# Altium schematic sheet 06_OLED_SHT3X.SchDoc
size A3; SheetNumber: 6; SheetTotal: 7
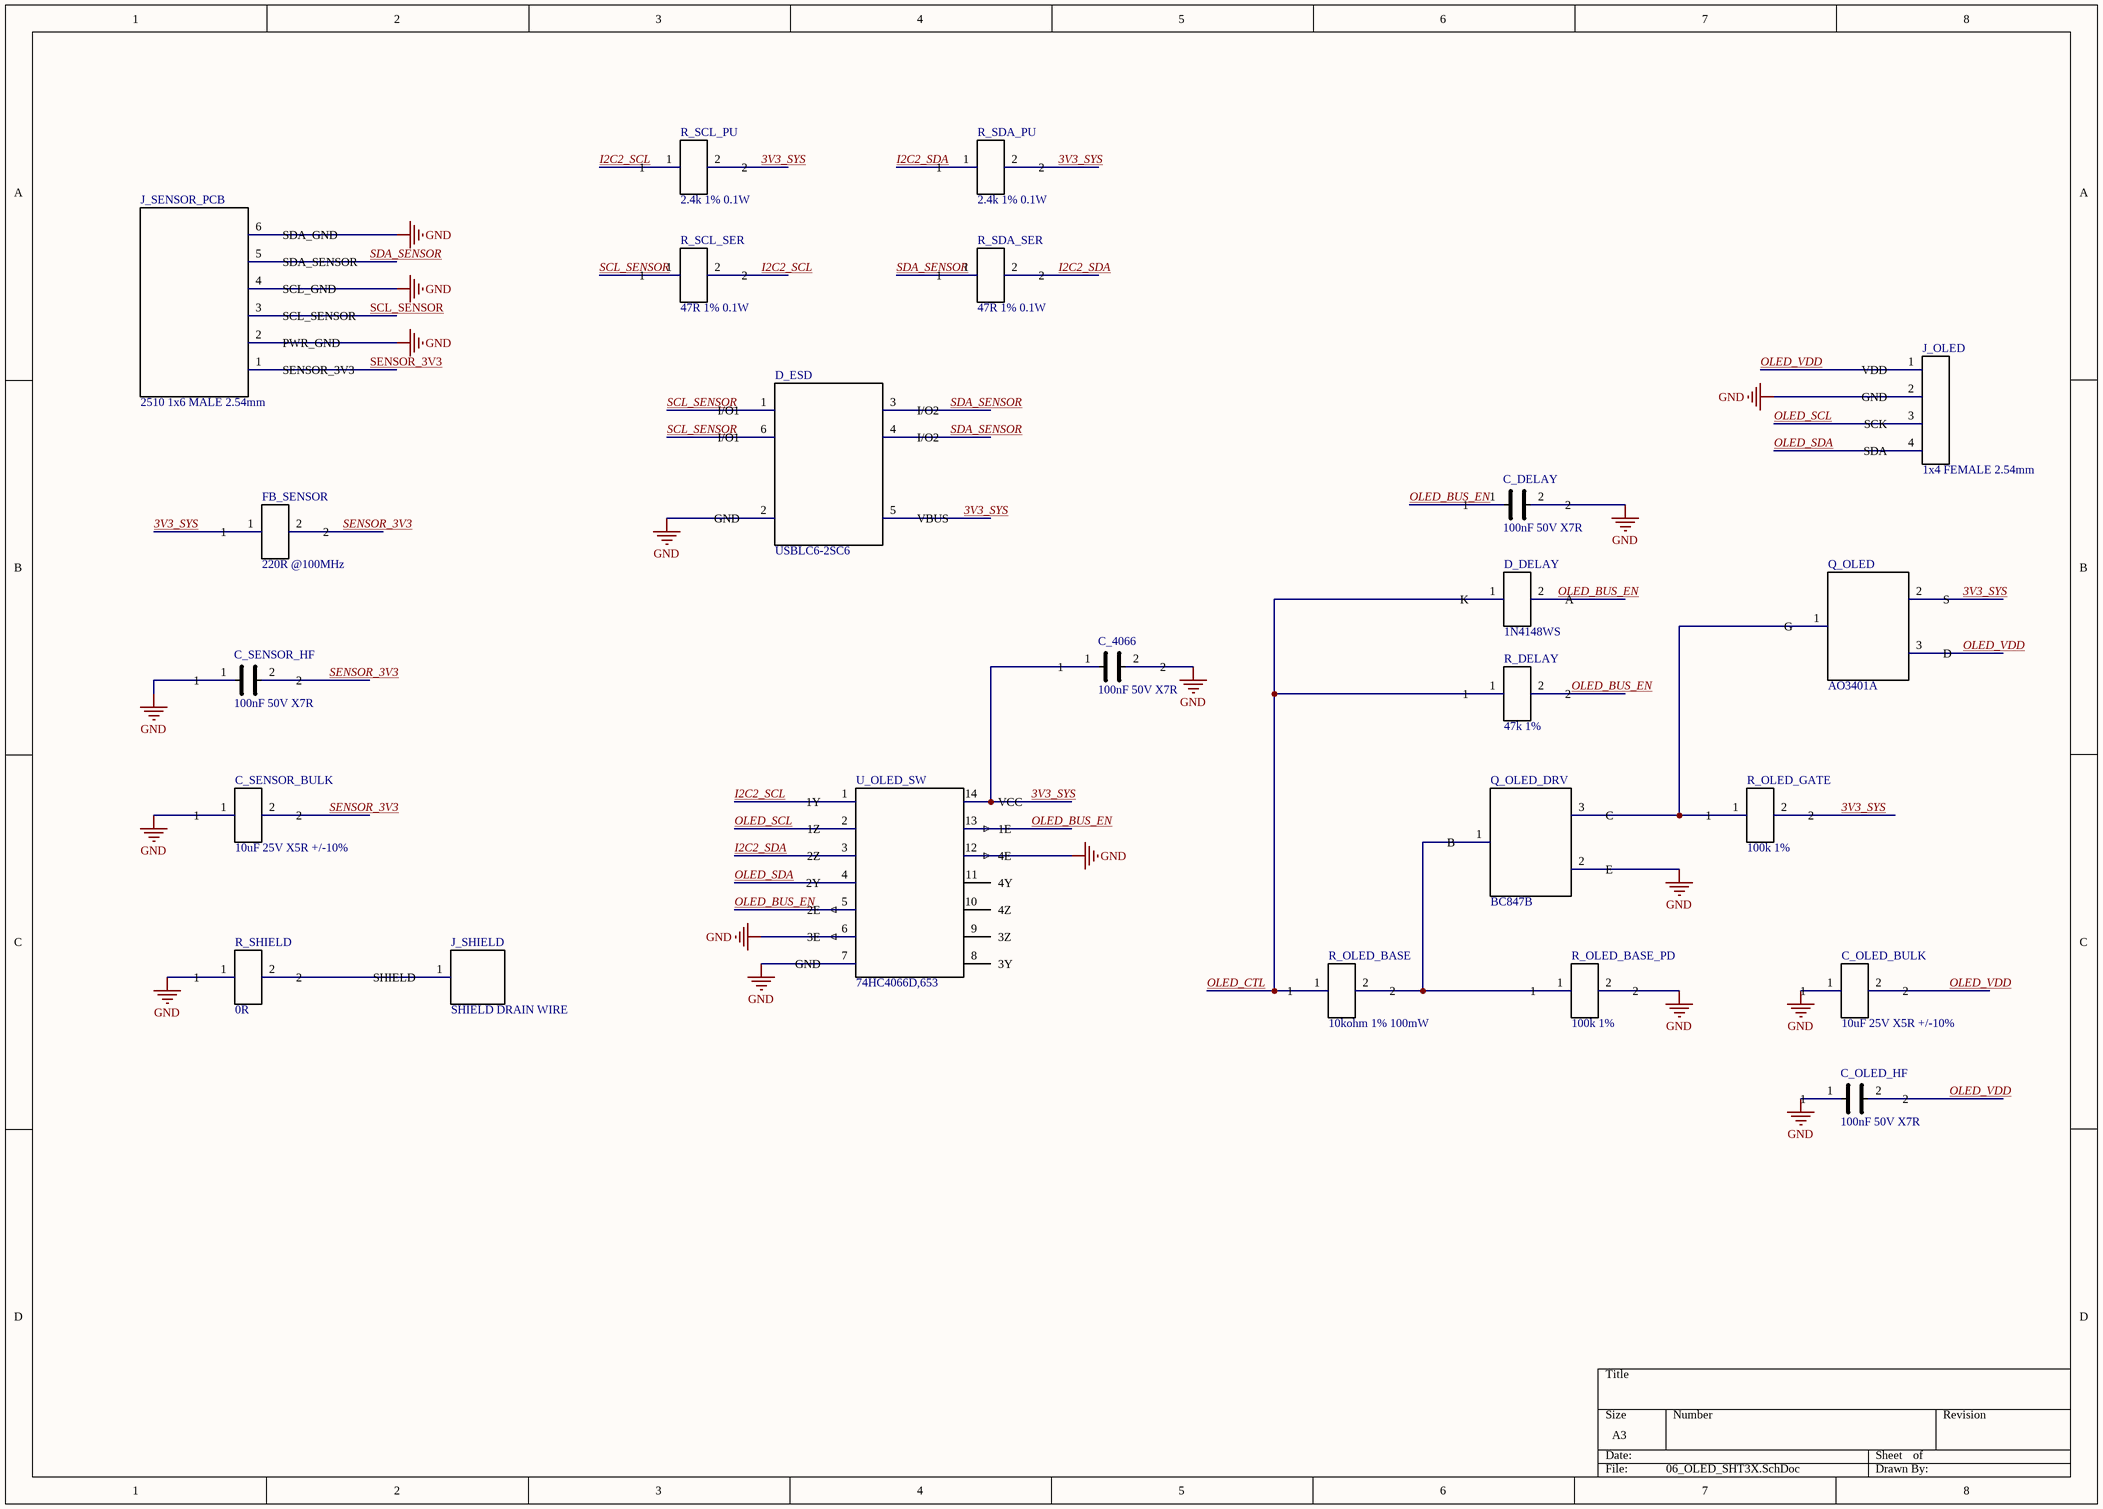
[diagram p0: 06_OLED_SHT3X.SchDoc]

## Parts
C_4066  100nF 50V X7R  [SAMSUNG_CL10_0603_CAP_2P]
C_DELAY  100nF 50V X7R  [SAMSUNG_CL10_0603_CAP_2P]
C_OLED_BULK  10uF 25V X5R +/-10%  [MURATA_GRM21_0805_CAP_2P]
C_OLED_HF  100nF 50V X7R  [SAMSUNG_CL10_0603_CAP_2P]
C_SENSOR_BULK  10uF 25V X5R +/-10%  [MURATA_GRM21_0805_CAP_2P]
C_SENSOR_HF  100nF 50V X7R  [SAMSUNG_CL10_0603_CAP_2P]
D_DELAY  1N4148WS  [DIODES_SOD323_1N4148WS_2P]
D_ESD  USBLC6-2SC6  [ST_SOT23_6L_USBLC6_6P]
FB_SENSOR  220R @100MHz  [RES_0805_SHARED_2P]
J_OLED  1x4 FEMALE 2.54mm  [GENERIC_SOCKET_1X4_P2P54_THT]
J_SENSOR_PCB  2510 1x6 MALE 2.54mm  [GENERIC_2510_1X6_P2P54_THT]
J_SHIELD  SHIELD DRAIN WIRE  [WIRE_DRAIN_1P_D1P20_P2P40_THT]
Q_OLED  AO3401A  [AOS_SOT23_AO3401A_3P]
Q_OLED_DRV  BC847B  [NEXPERIA_SOT23_TO236AB_3P]
R_DELAY  47k 1%  [RES_0603_SHARED_2P]
R_OLED_BASE  10kohm 1% 100mW  [RES_0603_SHARED_2P]
R_OLED_BASE_PD  100k 1%  [RES_0603_SHARED_2P]
R_OLED_GATE  100k 1%  [RES_0603_SHARED_2P]
R_SCL_PU  2.4k 1% 0.1W  [RES_0603_SHARED_2P]
R_SCL_SER  47R 1% 0.1W  [RES_0603_SHARED_2P]
R_SDA_PU  2.4k 1% 0.1W  [RES_0603_SHARED_2P]
R_SDA_SER  47R 1% 0.1W  [RES_0603_SHARED_2P]
R_SHIELD  0R  [RES_0603_SHARED_2P]
U_OLED_SW  74HC4066D,653  [NEXPERIA_SOT108_1_SO14_14P]

## Nets
GND: C_4066.2 C_DELAY.2 C_OLED_BULK.1 C_OLED_HF.1 C_SENSOR_BULK.1 C_SENSOR_HF.1 D_ESD.2(GND) J_OLED.2(GND) J_SENSOR_PCB.2(PWR_GND) J_SENSOR_PCB.4(SCL_GND) J_SENSOR_PCB.6(SDA_GND) Q_OLED_DRV.2(E) R_OLED_BASE_PD.2 R_SHIELD.1 U_OLED_SW.6(3E) U_OLED_SW.7(GND) U_OLED_SW.12(4E)
3V3_SYS: C_4066.1 D_ESD.5(VBUS) FB_SENSOR.1 Q_OLED.2(S) R_OLED_GATE.2 R_SCL_PU.2 R_SDA_PU.2 U_OLED_SW.14(VCC)
I2C2_SCL: R_SCL_PU.1 R_SCL_SER.2 U_OLED_SW.1(1Y)
I2C2_SDA: R_SDA_PU.1 R_SDA_SER.2 U_OLED_SW.3(2Z)
OLED_BUS_EN: C_DELAY.1 D_DELAY.2(A) R_DELAY.2 U_OLED_SW.5(2E) U_OLED_SW.13(1E)
OLED_CTL: D_DELAY.1(K) R_DELAY.1 R_OLED_BASE.1
OLED_SCL: J_OLED.3(SCK) U_OLED_SW.2(1Z)
OLED_SDA: J_OLED.4(SDA) U_OLED_SW.4(2Y)
OLED_VDD: C_OLED_BULK.2 C_OLED_HF.2 J_OLED.1(VDD) Q_OLED.3(D)
SCL_SENSOR: D_ESD.1(I/O1) D_ESD.6(I/O1) J_SENSOR_PCB.3(SCL_SENSOR) R_SCL_SER.1
SDA_SENSOR: D_ESD.3(I/O2) D_ESD.4(I/O2) J_SENSOR_PCB.5(SDA_SENSOR) R_SDA_SER.1
SENSOR_3V3: C_SENSOR_BULK.2 C_SENSOR_HF.2 FB_SENSOR.2 J_SENSOR_PCB.1(SENSOR_3V3)
NetJ_SHIELD_1: J_SHIELD.1(SHIELD) R_SHIELD.2
NetQ_OLED_1: Q_OLED.1(G) Q_OLED_DRV.3(C) R_OLED_GATE.1
NetQ_OLED_DRV_1: Q_OLED_DRV.1(B) R_OLED_BASE.2 R_OLED_BASE_PD.1

Not connected (* = marked no-connect by the designer): U_OLED_SW 8(3Y) 9(3Z) 10(4Z) 11(4Y)

## Library data of the parts
C_4066 C_DELAY C_OLED_HF C_SENSOR_HF = CL10B104KB8NNNC: MCU-core ceramic capacitor; Manufacturer: Samsung Electro-Mechanics; Source_Baseline: MCU_SCHEMATIC_ENTRY_BASELINE_v2.1_FA.txt; Design_Status: DESIGN_LOCK_MCU_CORE_V2.1_FOOTPRINT_HOLD; Qualification_Status: UNQUALIFIED_PENDING_SAVE_REOPEN_AUDIT; PIN_NUMBER_SOURCE: INTERNAL_CONVENTION; PIN_FUNCTION_SOURCE: MANUFACTURER_DATASHEET; MPN: CL10B104KB8NNNC; Value: 100nF 50V X7R; Package: 0603 / 1608 metric; Datasheet: https://product.samsungsem.com/mlcc/CL10B104KB8NNN.do
C_OLED_BULK C_SENSOR_BULK = GRM21BR61E106KA73L: MicroSD local mid-value ceramic capacitor; Manufacturer: Murata Manufacturing; Source_Baseline: MICROSD_SCHEMATIC_ENTRY_BASELINE_v1.2_FA.txt; Design_Status: DESIGN_LOCK_MICROSD_V1.2_FOOTPRINT_COMPARE_PENDING; Qualification_Status: UNQUALIFIED_PENDING_SAVE_REOPEN_AUDIT; PIN_NUMBER_SOURCE: INTERNAL_CONVENTION_1_2; PIN_FUNCTION_SOURCE: MANUFACTURER_PRODUCT_DATA; MPN: GRM21BR61E106KA73L; Value: 10uF 25V X5R +/-10%; Package: 2012M / EIA 0805; Datasheet: https://pim.murata.com/en-global/pim/details/?partNum=GRM21BR61E106KA73%23
D_DELAY = 1N4148WS: Fast switching diode; SOD323; pin 1 cathode K, pin 2 anode A for Task19 delay discharge path; Manufacturer: MULTISOURCE; FOOTPRINT GEOMETRY SOURCE=Diodes Incorporated; Source_Baseline: Datalogger_OLED_SHT3x_Final_BOM_RevA_v1.3_FA.pdf + TASK18_RTC_RELEASE_2026-08-22 + TASK19_CONTROLLED_DELTAS_2026-08-22; Design_Status: TASK19_BOM_DEVICE_GEOMETRY_DIODES_INC_REFERENCE; Qualification_Status: UNQUALIFIED_PENDING_SAVE_REOPEN_AUDIT; PIN_NUMBER_SOURCE: MANUFACTURER_DATASHEET; MPN: 1N4148WS; Value: 1N4148WS; Package: SOD323; Datasheet: https://www.diodes.com/datasheet/download/1N4148WS.pdf; PIN_FUNCTION_SOURCE: MANUFACTURER_DATASHEET
D_ESD = USBLC6-2SC6: Two-line low-capacitance ESD protector; ST device purchased for Rev-A; Manufacturer: STMicroelectronics; Source_Baseline: MICROSD_SCHEMATIC_ENTRY_BASELINE_v1.2_FA.txt; Design_Status: DESIGN_LOCK_MICROSD_V1.2_ST_PROCUREMENT; Qualification_Status: UNQUALIFIED_PENDING_SAVE_REOPEN_AUDIT; PIN_NUMBER_SOURCE: MANUFACTURER_DATASHEET; MPN: USBLC6-2SC6; Value: USBLC6-2SC6; Package: SOT23-6L; Datasheet: https://www.st.com/resource/en/datasheet/usblc6-2.pdf; PIN_FUNCTION_SOURCE: MANUFACTURER_DATASHEET
FB_SENSOR = BLM21PG221SN1D: Murata BLM21PG ferrite bead, 0805/2012, Task19 sensor supply filter; Manufacturer: Murata Manufacturing Co., Ltd.; Source_Baseline: Datalogger_OLED_SHT3x_Final_BOM_RevA_v1.3_FA.pdf + TASK18_RTC_RELEASE_2026-08-22 + TASK19_CONTROLLED_DELTAS_2026-08-22; Design_Status: TASK19_CONTROLLED_BOM_REUSE_RES_0805_SHARED_2P; Qualification_Status: UNQUALIFIED_PENDING_SAVE_REOPEN_AUDIT; PIN_NUMBER_SOURCE: INTERNAL_CONVENTION; PIN_FUNCTION_SOURCE: SYMMETRIC_PASSIVE_DEVICE; MPN: BLM21PG221SN1D; Value: 220R @100MHz; Package: 0805 / 2012 metric; Datasheet: Murata official BLM21PG221SN1D product data
J_OLED = PBS-2.54-1X4GF: Generic 1x4 straight female THT socket for OLED module; purchase identity PBS-2.54-1X4GF; module side is male; Source_Baseline: Datalogger_OLED_SHT3x_Final_BOM_RevA_v1.3_FA.pdf + TASK18_RTC_RELEASE_2026-08-22 + TASK19_CONTROLLED_DELTAS_2026-08-22; Design_Status: TASK19_GENERIC_HEADER_USER_APPROVED_2026-08-22; Qualification_Status: UNQUALIFIED_PENDING_SAVE_REOPEN_AUDIT; PIN_NUMBER_SOURCE: PROJECT_INTERNAL_LEFT_TO_RIGHT_1_TO_4; PIN_FUNCTION_SOURCE: OLED_MODULE_PRINT_AND_CONTROLLED_BOM; Manufacturer: GENERIC; MPN: PBS-2.54-1X4GF; Value: 1x4 FEMALE 2.54mm; Package: THT 1x4, pitch 2.54 mm; Datasheet: Generic geometry reference: Wurth Elektronik 61300411821; project user approval 2026-08-22
J_SENSOR_PCB = 2510-1X6-MALE-THT: PCB-mounted internal SHT3x harness connector; 6-pin straight male 2.54 mm 2510-style THT; external metal/military panel connector remains separate; Manufacturer: GENERIC; Source_Baseline: T20_USER_APPROVAL_2026-08-26; Design_Status: TASK20_CONTROLLED_PCB_CONNECTOR; Qualification_Status: MECHANICAL_FIT_PENDING_PHYSICAL_SAMPLE; PIN_NUMBER_SOURCE: PROJECT_INTERNAL_PCB_ORDER_LOCK_2026-08-26; PIN_FUNCTION_SOURCE: USER_APPROVED_T20_SIGNAL_ORDER_2026-08-26; MPN: 2510-1X6-MALE-THT; Value: 2510 1x6 MALE 2.54mm; Package: THT 1x6, pitch 2.54 mm; Datasheet: USER_SUPPLIED_6CCT_2P54_DRAWING_2026-08-26; supplier code 2171001040
J_SHIELD = WIRE_DRAIN_1P_THT: Dedicated PCB termination for external cable shield/drain wire; 1-pin THT solder pad; Task20 controlled; Manufacturer: GENERIC; Design_Status: TASK20_CONTROLLED; Qualification_Status: PHYSICAL_FIT_PENDING; Cable_Target: 3-pair x 24AWG shielded, drain wire; MPN: WIRE_DRAIN_1P_THT; Value: SHIELD DRAIN WIRE; Package: 1-pin THT solder pad
Q_OLED = AO3401A: -30V P-channel MOSFET used as switched SD_VDD high-side pass element; Manufacturer: Alpha & Omega Semiconductor; Source_Baseline: MICROSD_SCHEMATIC_ENTRY_BASELINE_v1.2_FA.txt; Design_Status: DESIGN_LOCK_MICROSD_V1.2_PIN_NUMBER_CONVENTION_PENDING_FOOTPRINT_CROSSCHECK; Qualification_Status: UNQUALIFIED_PENDING_SAVE_REOPEN_AUDIT; PIN_NUMBER_SOURCE: INTERNAL_CONVENTION_PENDING_PHYSICAL_ORIENTATION_CROSSCHECK; PIN_FUNCTION_SOURCE: MANUFACTURER_DATASHEET; MPN: AO3401A; Value: AO3401A; Package: SOT-23; Datasheet: https://www.aosmd.com/sites/default/files/res/datasheets/AO3401A.pdf
Q_OLED_DRV = BC847B: 45V 100mA NPN general-purpose transistor used as SD gate driver; Manufacturer: Nexperia; Source_Baseline: MICROSD_SCHEMATIC_ENTRY_BASELINE_v1.2_FA.txt; Design_Status: DESIGN_LOCK_MICROSD_V1.2; Qualification_Status: UNQUALIFIED_PENDING_SAVE_REOPEN_AUDIT; PIN_NUMBER_SOURCE: MANUFACTURER_DATASHEET; MPN: BC847B; Value: BC847B; Package: SOT-23 / TO-236AB; Datasheet: https://assets.nexperia.com/documents/data-sheet/BC847X_SER.pdf; PIN_FUNCTION_SOURCE: MANUFACTURER_DATASHEET
R_DELAY = 0603WAF4702T5E: OVP resistor; Manufacturer: UNI-ROYAL; Source_Baseline: POWER_SCHEMATIC_ENTRY_BASELINE_v0.17_FA.txt; Design_Status: CONTROLLED_V0.17_P9; Qualification_Status: UNQUALIFIED_PENDING_SAVE_REOPEN_AUDIT; PIN_NUMBER_SOURCE: INTERNAL_CONVENTION; PIN_FUNCTION_SOURCE: MANUFACTURER_DATASHEET; MPN: 0603WAF4702T5E; Value: 47k 1%; Package: 0603; Datasheet: UNI-ROYAL manufacturer resistor data
R_OLED_BASE = CR0603FA1002G: MicroSD SD gate-driver base resistor; Manufacturer: LIZ [supplier-listed]; Source_Baseline: MICROSD_SCHEMATIC_ENTRY_BASELINE_v1.2_FA.txt; Design_Status: DESIGN_LOCK_MICROSD_V1.2_FOOTPRINT_SOURCE_HOLD; Qualification_Status: UNQUALIFIED_PENDING_SAVE_REOPEN_AUDIT; PIN_NUMBER_SOURCE: INTERNAL_CONVENTION_1_2; PIN_FUNCTION_SOURCE: CONTROLLED_BOM_PLUS_EXACT_PART_LISTING; MPN: CR0603FA1002G; Value: 10kohm 1% 100mW; Package: 0603; Datasheet: MicroSD v1.3 plus exact-part supplier listing
R_OLED_BASE_PD R_OLED_GATE = 0603WAF1003T5E: OVP resistor; Manufacturer: UNI-ROYAL; Source_Baseline: POWER_SCHEMATIC_ENTRY_BASELINE_v0.17_FA.txt; Design_Status: CONTROLLED_V0.17_P9; Qualification_Status: UNQUALIFIED_PENDING_SAVE_REOPEN_AUDIT; PIN_NUMBER_SOURCE: INTERNAL_CONVENTION; PIN_FUNCTION_SOURCE: MANUFACTURER_DATASHEET; MPN: 0603WAF1003T5E; Value: 100k 1%; Package: 0603; Datasheet: UNI-ROYAL manufacturer resistor data
R_SCL_PU R_SDA_PU = 0603WAF2401T5E: Task19 external SHT3x I2C pull-up resistor; Manufacturer: UNI-ROYAL; Source_Baseline: Datalogger_OLED_SHT3x_Final_BOM_RevA_v1.3_FA.pdf + TASK18_RTC_RELEASE_2026-08-22 + TASK19_CONTROLLED_DELTAS_2026-08-22; Design_Status: TASK19_CONTROLLED_BOM_REUSE_RES_0603_SHARED_2P; Qualification_Status: UNQUALIFIED_PENDING_SAVE_REOPEN_AUDIT; PIN_NUMBER_SOURCE: INTERNAL_CONVENTION; PIN_FUNCTION_SOURCE: SYMMETRIC_PASSIVE_DEVICE; MPN: 0603WAF2401T5E; Value: 2.4k 1% 0.1W; Package: 0603 / 1608 metric; Datasheet: Controlled BOM value/package; existing UNI-ROYAL WAF family in released project library
R_SCL_SER R_SDA_SER = 0603WAF470JT5E: Task19 SHT3x I2C series resistor; Manufacturer: UNI-ROYAL; Source_Baseline: Datalogger_OLED_SHT3x_Final_BOM_RevA_v1.3_FA.pdf + TASK18_RTC_RELEASE_2026-08-22 + TASK19_CONTROLLED_DELTAS_2026-08-22; Design_Status: TASK19_CONTROLLED_BOM_REUSE_RES_0603_SHARED_2P; Qualification_Status: UNQUALIFIED_PENDING_SAVE_REOPEN_AUDIT; PIN_NUMBER_SOURCE: INTERNAL_CONVENTION; PIN_FUNCTION_SOURCE: SYMMETRIC_PASSIVE_DEVICE; MPN: 0603WAF470JT5E; Value: 47R 1% 0.1W; Package: 0603 / 1608 metric; Datasheet: Controlled BOM value/package; existing UNI-ROYAL WAF family in released project library
R_SHIELD = SER0603J0R: Zero-ohm mode strap; Manufacturer: VICO / Anhui Xiangsheng Technology; Source_Baseline: POWER_SCHEMATIC_ENTRY_BASELINE_v0.17_FA.txt; Design_Status: DESIGN_LOCK_V0.17; Qualification_Status: UNQUALIFIED_PENDING_SAVE_REOPEN_AUDIT; PIN_NUMBER_SOURCE: INTERNAL_CONVENTION; PIN_FUNCTION_SOURCE: MANUFACTURER_DATASHEET; MPN: SER0603J0R; Value: 0R; Package: 0603; Datasheet: SER0603J0R-VO-Sub-Brand-(ER).pdf
U_OLED_SW = 74HC4066D,653: Nexperia quad SPST analog switch; enable inputs active HIGH; SO14 SOT108-1; Source_Baseline: Datalogger_OLED_SHT3x_Final_BOM_RevA_v1.3_FA.pdf + TASK18_RTC_RELEASE_2026-08-22 + TASK19_CONTROLLED_DELTAS_2026-08-22; Design_Status: TASK19_CONTROLLED_NEXPERIA_REV12; Qualification_Status: UNQUALIFIED_PENDING_SAVE_REOPEN_AUDIT; PIN_NUMBER_SOURCE: MANUFACTURER_DATASHEET; Manufacturer: Nexperia; MPN: 74HC4066D,653; Value: 74HC4066D,653; Package: SO14 / SOT108-1; Datasheet: https://assets.nexperia.com/documents/data-sheet/74HC_HCT4066.pdf; PIN_FUNCTION_SOURCE: MANUFACTURER_DATASHEET